# Altium schematic sheet Dahili_Birimler.SchDoc
size A4; SheetNumber: 6; SheetTotal: 6
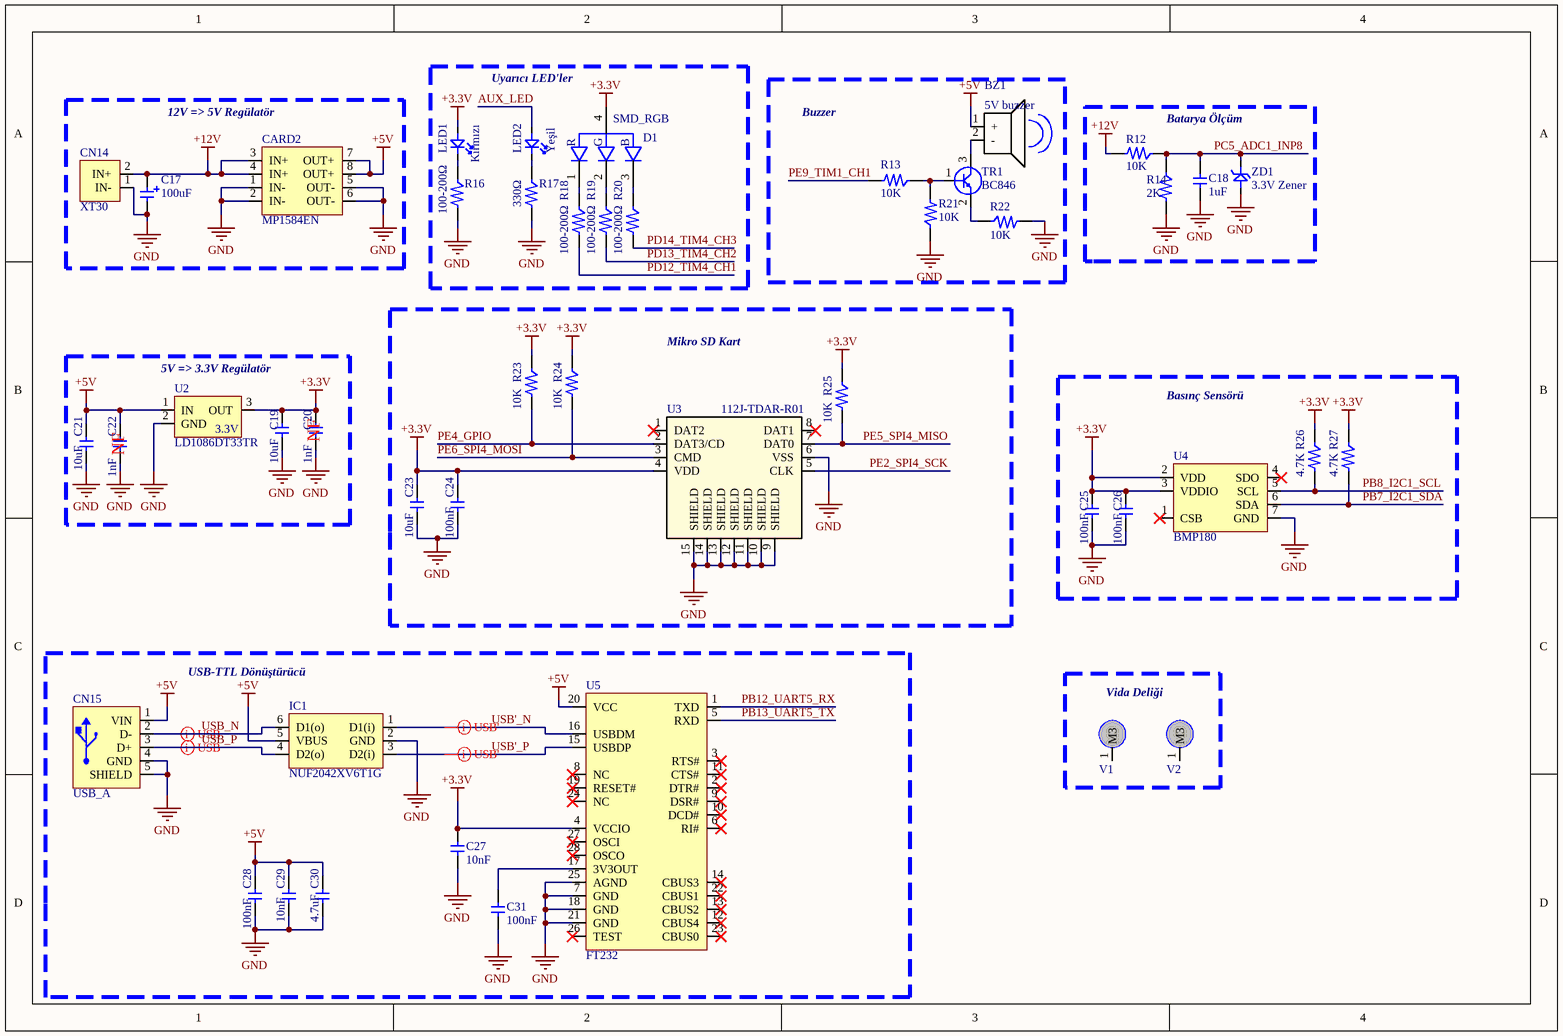
[diagram p0: Dahili_Birimler.SchDoc]

## Parts
BZ1  5V buzzer  [5v buzer]
C17  value 100uF  [CAP_Elec]  (hidden comment: CAP_Elec)
C18  value 1uF  [CAP_0603]  (hidden comment: CAP_0603)
C19  value 10uF  [CAP_0603]  (hidden comment: CAP_0603)
C20  value 1nF  [CAP_0603]  (hidden comment: CAP_0603)
C21  value 10uF  [CAP_0603]  (hidden comment: CAP_0603)
C22  value 1nF  [CAP_0603]  (hidden comment: CAP_0603)
C23  value 10uF  [CAP_0603]  (hidden comment: CAP_0603)
C24  value 100nF  [CAP_0603]  (hidden comment: CAP_0603)
C25  value 100nF  [CAP_0603]  (hidden comment: CAP_0603)
C26  value 100nF  [CAP_0603]  (hidden comment: CAP_0603)
C27  value 10nF  [CAP_0603]  (hidden comment: CAP_0603)
C28  value 100nF  [CAP_0603]  (hidden comment: CAP_0603)
C29  value 10nF  [CAP_0603]  (hidden comment: CAP_0603)
C30  value 4.7uF  [CAP_0603]  (hidden comment: CAP_0603)
C31  value 100nF  [CAP_0603]  (hidden comment: CAP_0603)
CARD2  MP1584EN  [MP1584]
CN14  XT30  [XT30]
CN15  USB_A  [USB_A]
D1  SMD_RGB  [LED_LTST-C19HE1WT]
IC1  NUF2042XV6T1G  [SOT-563-6]
LED1  Kırmızı  [1206_LED]
LED2  Yeşil  [1206_LED]
R12  value 10K  [RES_0603]  (hidden comment: RES_0603)
R13  value 10K  [RES_0603]  (hidden comment: RES_0603)
R14  value 2K  [RES_0603]  (hidden comment: RES_0603)
R16  value 100-200Ω  [RES_0603]  (hidden comment: RES_0603)
R17  value 330Ω  [RES_0603]  (hidden comment: RES_0603)
R18  value 100-200Ω  [RES_0603]  (hidden comment: RES_0603)
R19  value 100-200Ω  [RES_0603]  (hidden comment: RES_0603)
R20  value 100-200Ω  [RES_0603]  (hidden comment: RES_0603)
R21  value 10K  [RES_0603]  (hidden comment: RES_0603)
R22  value 10K  [RES_0603]  (hidden comment: RES_0603)
R23  value 10K  [RES_0603]  (hidden comment: RES_0603)
R24  value 10K  [RES_0603]  (hidden comment: RES_0603)
R25  value 10K  [RES_0603]  (hidden comment: RES_0603)
R26  value 4.7K  [RES_0603]  (hidden comment: RES_0603)
R27  value 4.7K  [RES_0603]  (hidden comment: RES_0603)
TR1  BC846  [SOT-23]
U2  LD1086DT33TR  [DPAK]
U3  112J-TDAR-R01  [112J-TDAR-R01_ATT]
U4  BMP180  [BMP180]
U5  FT232  [SSOP-28]
V1  Vida Deliği 3mm  [m3_vide_deliği]  (value not drawn)
V2  Vida Deliği 3mm  [m3_vide_deliği]  (value not drawn)
ZD1  3.3V Zener  [SOD-123]

## Blocks framed on the sheet
Buzzer: BZ1 R13 R21 R22 TR1
12V => 5V Regülatör: C17 CARD2 CN14
Mikro SD Kart: C23 C24 R23-R25 U3
USB-TTL Dönüştürücü: C27-C31 CN15 IC1 U5
Vida Deliği: V1 V2

## Nets
+3.3V: C19.2 C20.2 C23.2 C24.2 C25.2 C26.2 C27.2 D1.4 LED1.1 R23.2 R24.2 R25.2 R26.2 R27.2 U2.3(OUT) U3.4(VDD) U4.2(VDD) U4.3(VDDIO) U5.4(VCCIO)
+5V: BZ1.1(+) C21.2 C22.2 C28.2 C29.2 C30.2 CARD2.7(OUT+) CARD2.8(OUT+) CN15.1(VIN) IC1.5(VBUS) U2.1(IN) U5.20(VCC)
+12V: C17.1 CARD2.3(IN+) CARD2.4(IN+) CN14.2(IN+) R12.1
GND: C17.2 C18.1 C19.1 C20.1 C21.1 C22.1 C23.1 C24.1 C25.1 C26.1 C27.1 C28.1 C29.1 C30.1 C31.1 CARD2.1(IN-) CARD2.2(IN-) CARD2.5(OUT-) CARD2.6(OUT-) CN14.1(IN-) CN15.4(GND) CN15.5(SHIELD) IC1.2(GND) R14.1 R16.1 R17.1 R21.2 R22.1 U2.2(GND) U3.6(VSS) U3.9(SHIELD) U3.10(SHIELD) U3.11(SHIELD) U3.12(SHIELD) U3.13(SHIELD) U3.14(SHIELD) U3.15(SHIELD) U4.7(GND) U5.7(GND) U5.18(GND) U5.21(GND) U5.25(AGND) ZD1.1
AUX_LED: LED2.1
PB7_I2C1_SDA: R27.1 U4.6(SDA)
PB8_I2C1_SCL: R26.1 U4.5(SCL)
PB12_UART5_RX: U5.1(TXD)
PB13_UART5_TX: U5.5(RXD)
PC5_ADC1_INP8: C18.2 R12.2 R14.2 ZD1.2
PD12_TIM4_CH1: R18.1
PD13_TIM4_CH2: R19.1
PD14_TIM4_CH3: R20.1
PE2_SPI4_SCK: U3.5(CLK)
PE4_GPIO: R23.1 U3.2(DAT3/CD)
PE5_SPI4_MISO: R25.1 U3.7(DAT0)
PE6_SPI4_MOSI: R24.1 U3.3(CMD)
PE9_TIM1_CH1: R13.1
USB'_N: IC1.1(D1(i)) U5.16(USBDM)
USB'_P: IC1.3(D2(i)) U5.15(USBDP)
USB_N: CN15.2(D-) IC1.6(D1(o))
USB_P: CN15.3(D+) IC1.4(D2(o))
NetBZ1_2: BZ1.2(-) TR1.3(G)
NetC31_2: C31.2 U5.17(3V3OUT)
NetD1_1: D1.1 R18.2
NetD1_2: D1.2 R19.2
NetD1_3: D1.3 R20.2
NetLED1_2: LED1.2 R16.2
NetLED2_2: LED2.2 R17.2
NetR13_2: R13.2 R21.1 TR1.1(G)
NetR22_2: R22.2 TR1.2(G)

Not connected (* = marked no-connect by the designer): U3 1(DAT2)* 8(DAT1)*; U4 1(CSB)* 4(SDO)*; U5 2(DTR#)* 3(RTS#)* 6(RI#)* 8(NC)* 9(DSR#)* 10(DCD#)* 11(CTS#)* 12(CBUS4)* 13(CBUS2)* 14(CBUS3)* 19(RESET#)* 22(CBUS1)* 23(CBUS0)* 24(NC)* 26(TEST)* 27(OSCI)* 28(OSCO)*; V1 1(M3); V2 1(M3)

## Layout directives
differential pair; net class USB: USB_N, USB_P
differential pair; net class USB': USB'_N, USB'_P

## Notes on the sheet
- Uyarıcı LED'ler
- Batarya Ölçüm
- 5V => 3.3V Regülatör
- (near C22) NF
- (near C20) NF
- Basınç Sensörü
- (in symbol LD1086DT33TR) 3.3V
- (in symbol LTST-C19HE1WT) R; G; B

## Library data of the parts
BZ1 = Buzzer
CARD2 = MP1584EN_kartı
D1 = LTST-C19HE1WT: Red, Green, Blue (RGB) 624nm Red, 525nm Green, 470nm Blue LED Indication - Discrete 2.1V Red, 3.35V Green, 3.35V Blue 0606 (1616 Metric); MF: Lite-On Inc.; SnapEDA_Link: https://www.snapeda.com/parts/LTST-C19HE1WT/Lite-On/view-part/?ref=snap; Package: 0606 Lite-On; Value: *; MP: LTST-C19HE1WT; Check_prices: https://www.snapeda.com/parts/LTST-C19HE1WT/Lite-On/view-part/?ref=eda
LED1 LED2 = 1206_LED
U3 = 112J-TDAR-R01: Description; Manufacturer_Name: Attend; Copyright: Copyright (C) 2025 Ultra Librarian. All rights reserved.; Manufacturer_Part_Number: 112J-TDAR-R01; RefDes: RefDes; Type: Type
ZD1 = SMD_Zener_Diyot